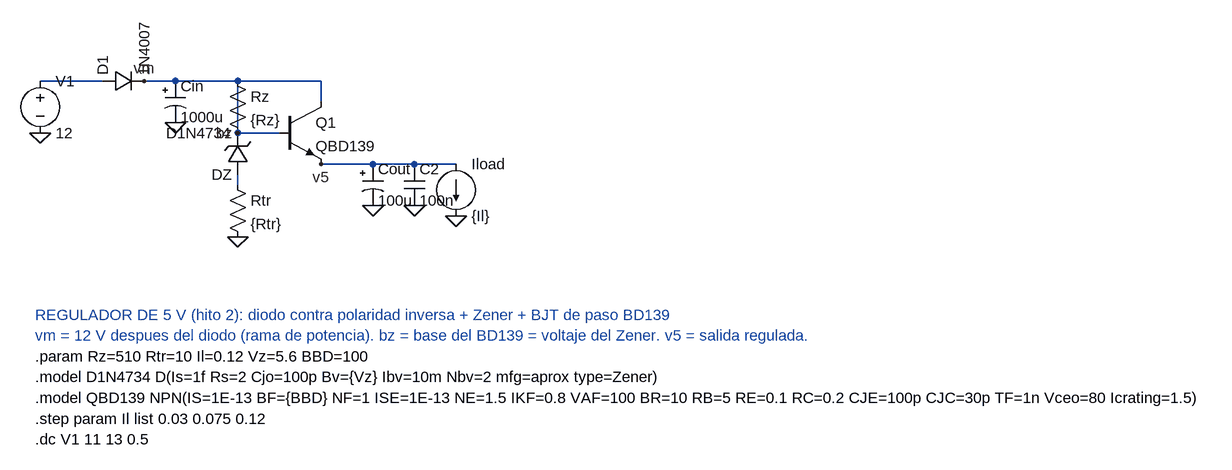
[diagram p0: schematic 1_regulador_5V.asc]
1_regulador_5V.asc, the LTspice schematic file:
Version 4
SHEET 1 880 680
WIRE -192 0 -96 0
WIRE -32 0 16 0
WIRE 16 0 112 0
WIRE 112 0 240 0
WIRE 112 0 112 80
WIRE 112 80 176 80
WIRE 240 0 240 32
WIRE 240 128 320 128
WIRE 320 128 384 128
WIRE 384 128 448 128
WIRE 112 144 112 160
FLAG -192 80 0
FLAG 16 64 0
FLAG 112 240 0
FLAG 320 192 0
FLAG 384 192 0
FLAG 448 208 0
FLAG -32 0 vm
FLAG 112 80 bz
FLAG 240 128 v5
SYMBOL voltage -192 -16 R0
SYMATTR InstName V1
SYMATTR Value 12
SYMBOL diode -96 16 R270
SYMATTR InstName D1
SYMATTR Value 1N4007
SYMBOL polcap 0 0 R0
SYMATTR InstName Cin
SYMATTR Value 1000u
SYMBOL res 96 -16 R0
SYMATTR InstName Rz
SYMATTR Value {Rz}
SYMBOL zener 128 144 R180
SYMATTR InstName DZ
SYMATTR Value D1N4734
SYMBOL res 96 144 R0
SYMATTR InstName Rtr
SYMATTR Value {Rtr}
SYMBOL npn 176 32 R0
SYMATTR InstName Q1
SYMATTR Value QBD139
SYMBOL polcap 304 128 R0
SYMATTR InstName Cout
SYMATTR Value 100u
SYMBOL cap 368 128 R0
SYMATTR InstName C2
SYMATTR Value 100n
SYMBOL current 448 128 R0
SYMATTR InstName Iload
SYMATTR Value {Il}
TEXT -200 360 Left 2 ;REGULADOR DE 5 V (hito 2): diodo contra polaridad inversa + Zener + BJT de paso BD139
TEXT -200 392 Left 2 ;vm = 12 V despues del diodo (rama de potencia). bz = base del BD139 = voltaje del Zener. v5 = salida regulada.
TEXT -200 424 Left 2 !.param Rz=510 Rtr=10 Il=0.12 Vz=5.6 BBD=100
TEXT -200 456 Left 2 !.model D1N4734 D(Is=1f Rs=2 Cjo=100p Bv={Vz} Ibv=10m Nbv=2 mfg=aprox type=Zener)
TEXT -200 488 Left 2 !.model QBD139 NPN(IS=1E-13 BF={BBD} NF=1 ISE=1E-13 NE=1.5 IKF=0.8 VAF=100 BR=10 RB=5 RE=0.1 RC=0.2 CJE=100p CJC=30p TF=1n Vceo=80 Icrating=1.5)
TEXT -200 520 Left 2 !.step param Il list 0.03 0.075 0.12
TEXT -200 552 Left 2 !.dc V1 11 13 0.5

The netlist it stands for:
* 1_regulador_5V.asc
V1 N001 0 12
D1 N001 bz 1N4007
Cin bz 0 1000u
Rz bz bz {Rz}
DZ N002 bz D1N4734
Rtr N002 0 {Rtr}
Q1 bz bz v5 0 QBD139
Cout v5 0 100u
C2 v5 0 100n
Iload v5 0 {Il}
.model D D
.lib standard.dio
.model NPN NPN
.model PNP PNP
.lib standard.bjt
* REGULADOR DE 5 V (hito 2): diodo contra polaridad inversa + Zener + BJT de paso BD139
* vm = 12 V despues del diodo (rama de potencia). bz = base del BD139 = voltaje del Zener. v5 = salida regulada.
.param Rz=510 Rtr=10 Il=0.12 Vz=5.6 BBD=100
.model D1N4734 D(Is=1f Rs=2 Cjo=100p Bv={Vz} Ibv=10m Nbv=2 mfg=aprox type=Zener)
.model QBD139 NPN(IS=1E-13 BF={BBD} NF=1 ISE=1E-13 NE=1.5 IKF=0.8 VAF=100 BR=10 RB=5 RE=0.1 RC=0.2 CJE=100p CJC=30p TF=1n Vceo=80 Icrating=1.5)
.step param Il list 0.03 0.075 0.12
.dc V1 11 13 0.5
.backanno
.end